# EAGLE schematic Driver Channel (EAGLE 9.7.0)
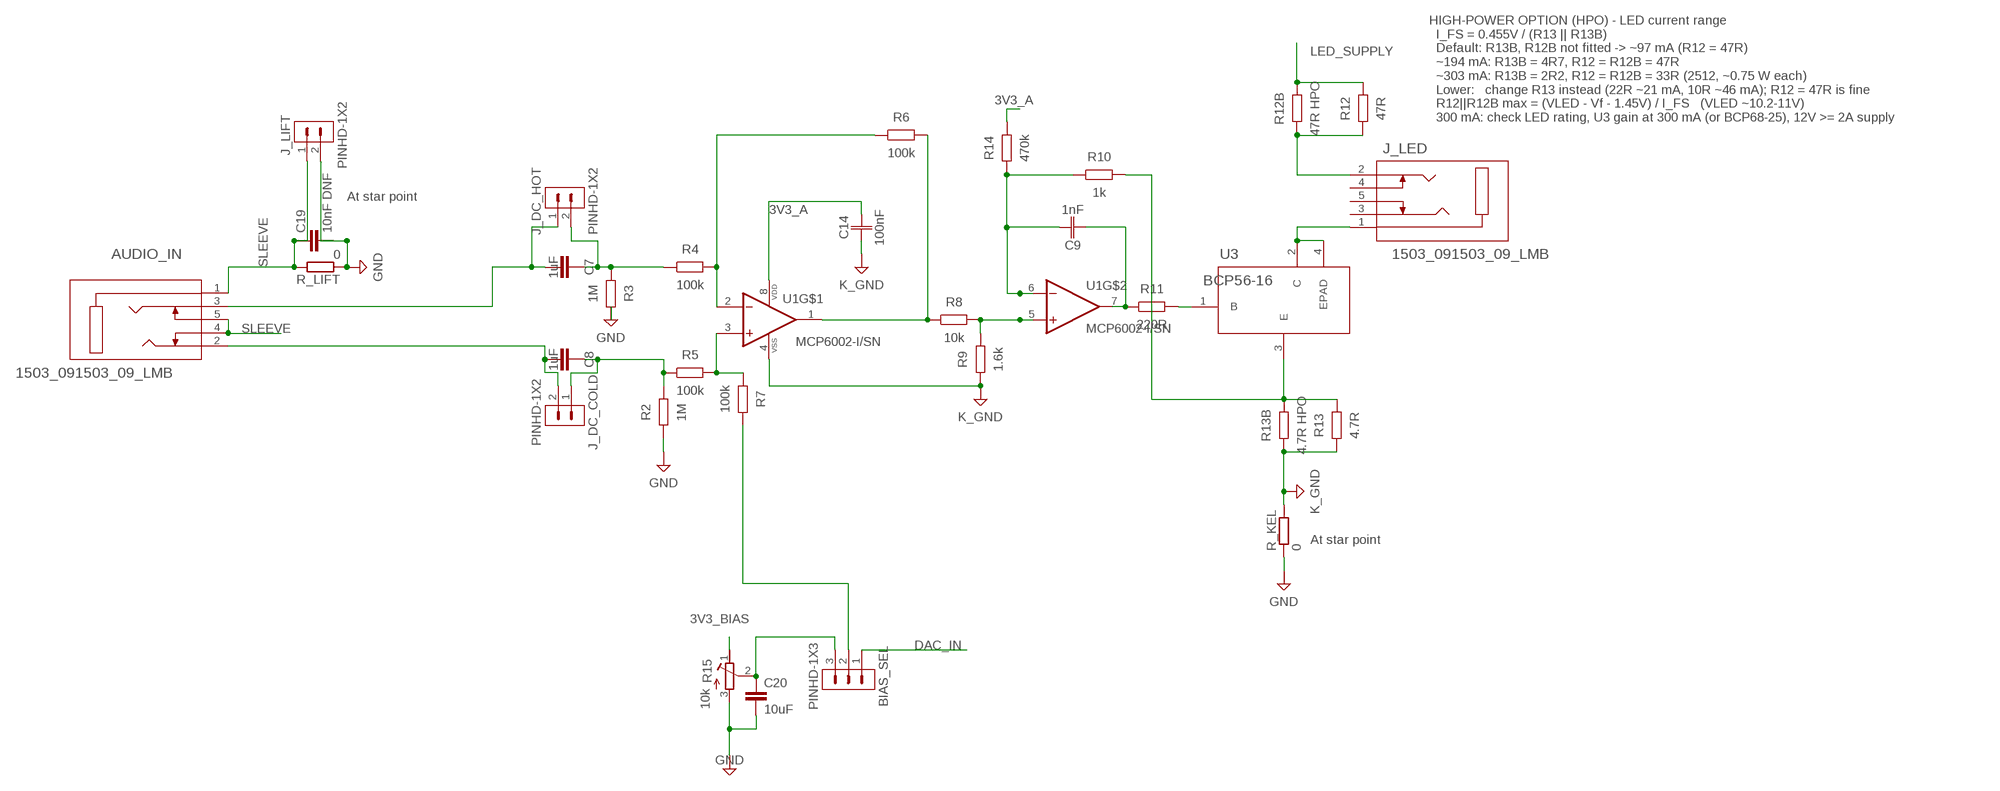
[diagram p0: schematic, sheet 1]

## Parts
AUDIO_IN  1503_091503_09_LMB  [1503_09_LMB]
BIAS_SEL  PINHD-1X3  [1X03]
C7  1uF  C-EUC0805  [C0805]
C8  1uF  C-EUC0805  [C0805]
C9  1nF  C_CHIP-0805(2012-METRIC)  [CAPC2012X110]
C14  100nF  C_CHIP-0805(2012-METRIC)  [CAPC2012X110]
C19  10nF DNF  C-EUC0805  [C0805]
C20  10uF  C-EUC0805  [C0805]
J_DC_COLD  PINHD-1X2  [1X02]
J_DC_HOT  PINHD-1X2  [1X02]
J_LED  1503_091503_09_LMB  [1503_09_LMB]
J_LIFT  PINHD-1X2  [1X02]
R2  1M  R_CHIP-1206(3216-METRIC)  [RESC3216X70]
R3  1M  R_CHIP-1206(3216-METRIC)  [RESC3216X70]
R4  100k  R_CHIP-1206(3216-METRIC)  [RESC3216X70]
R5  100k  R_CHIP-1206(3216-METRIC)  [RESC3216X70]
R6  100k  R_CHIP-1206(3216-METRIC)  [RESC3216X70]
R7  100k  R_CHIP-1206(3216-METRIC)  [RESC3216X70]
R8  10k  R_CHIP-1206(3216-METRIC)  [RESC3216X70]
R9  1.6k  R_CHIP-1206(3216-METRIC)  [RESC3216X70]
R10  1k  R_CHIP-1206(3216-METRIC)  [RESC3216X70]
R11  220R  R_CHIP-1206(3216-METRIC)  [RESC3216X70]
R12  47R  R_CHIP-2512(6332-METRIC)  [RESC6332X71]
R12B  47R HPO  R_CHIP-2512(6332-METRIC)  [RESC6332X71]
R13  4.7R  R_CHIP-1206(3216-METRIC)  [RESC3216X70]
R13B  4.7R HPO  R_CHIP-1206(3216-METRIC)  [RESC3216X70]
R14  470k  R_CHIP-1206(3216-METRIC)  [RESC3216X70]
R15  10k  R-TRIMM3314J  [RTRIM3314J]
R_KEL  0  R-EU_R0805  [R0805]
R_LIFT  0  R-EU_R0805  [R0805]
U1  MCP6002-I/SN  [SOIC127P600X175-8N]
U3  BCP56-16  BCP56-16T1GSOT-223_3P7X6P7_ONS  [SOT-223_3P7X6P7_ONS]

## Nets
3V3_A: C14.2 R14.2 U1.8(VDD)
3V3_BIAS: R15.1(E)
DAC_IN: BIAS_SEL.1
GND: C19.2 C20.2 J_LIFT.2 R2.1 R3.2 R15.3(A) R_KEL.1 R_LIFT.1
K_GND: C14.1 R9.1 R13.1 R13B.1 R_KEL.2 U1.4(VSS)
LED_SUPPLY: R12.2 R12B.2
N$1: C8.1 J_DC_COLD.1 R2.2 R5.1
N$2: C7.1 J_DC_HOT.2 R3.1 R4.1
N$3: R4.2 R6.1 U1.2(VINA-)
N$4: R5.2 R7.1 U1.3(VINA+)
N$5: R6.2 R8.1 U1.1(VOUTA)
N$6: R8.2 R9.2 U1.5(VINB+)
N$7: R11.2 U3.1(B)
N$8: J_LED.1 U3.2(C) U3.4(EPAD)
N$9: J_LED.2 R12.1 R12B.1
N$10: R10.2 R13.2 R13B.2 U3.3(E)
N$11: C9.1 R11.1 U1.7(VOUTB)
N$12: C9.2 R10.1 R14.1 U1.6(VINB-)
N$13: BIAS_SEL.3 C20.1 R15.2(S)
N$14: AUDIO_IN.2 C8.2 J_DC_COLD.2
N$15: AUDIO_IN.3 C7.2 J_DC_HOT.1
N$16: BIAS_SEL.2 R7.2
SLEEVE: AUDIO_IN.1 AUDIO_IN.4 AUDIO_IN.5 C19.1 J_LIFT.1 R_LIFT.2
Unconnected: J_LED.3 J_LED.4 J_LED.5

## Notes on the sheet
- HIGH-POWER OPTION (HPO) - LED current range
    I_FS = 0.455V / (R13 || R13B)
    Default: R13B, R12B not fitted -> ~97 mA (R12 = 47R)
    ~194 mA: R13B = 4R7, R12 = R12B = 47R
    ~303 mA: R13B = 2R2, R12 = R12B = 33R (2512, ~0.75 W each)
    Lower:   change R13 instead (22R ~21 mA, 10R ~46 mA); R12 = 47R is fine
    R12||R12B max = (VLED - Vf - 1.45V) / I_FS   (VLED ~10.2-11V)
    300 mA: check LED rating, U3 gain at 300 mA (or BCP68-25), 12V >= 2A supply
- At star point
- At star point

## Library data of the parts
AUDIO_IN J_LED = 3.5mm Jack:1503_09; COPYRIGHT: Copyright (C) 2026 Ultra Librarian. All rights reserved.; MANUFACTURER_NAME: Lumberg; MANUFACTURER_PART_NUMBER: 1503 09
BIAS_SEL = Connector:PINHD-1X3: Pin Header; CATEGORY_L1: Connectors; CATEGORY_L2: Headers; CATEGORY_L3: Male Pins; DESCRIPTION: Header-Straight-3 Position; PACKAGE: Through Hole; PITCH: 0.100" (2.54mm)
C7 C8 C19 C20 = rcl:C-EU: CAPACITOR, European symbol; SPICEPREFIX: C
C9 C14 = Capacitor:C: Capacitor - Generic; CATEGORY_L1: Capacitor; CATEGORY_L2: Ceramic Capacitors; CATEGORY_L3: MLCC; PACKAGE: Surface Mount; PACKAGE_SIZE: 0805
J_DC_COLD J_DC_HOT J_LIFT = Connector:PINHD-1X2: Pin Header; CATEGORY_L1: Connectors; CATEGORY_L2: Headers; CATEGORY_L3: Male Pins; DESCRIPTION: Header-Straight-2 Position; PACKAGE: Through Hole; PITCH: 0.100" (2.54mm)
R2-R11 R13 R13B R14 = Resistor:R: Resistor Fixed - Generic; CATEGORY_L1: Resistors; DESCRIPTION: Chip Resistor 3.20 X 1.60 X 0.70 mm body 1206(3216-METRIC) Package; PACKAGE: Surface Mount; PACKAGE_SIZE: 1206
R12 R12B = Resistor:R: Resistor Fixed - Generic; CATEGORY_L1: Resistors; DESCRIPTION: Chip Resistor 6.30 X 3.20 X 0.71 mm body 2512(6332-METRIC) Package; PACKAGE: Surface Mount; PACKAGE_SIZE: 2512
R15 = rcl:R-TRIMM: Trimm resistor; SPICEMODEL: X; SPICEPREFIXL: POT
R_KEL R_LIFT = rcl:R-EU_: RESISTOR, European symbol; SPICEPREFIX: R
U1 = MCP6002-I_SN:MCP6002-I/SN: Check availability <https://pricing.snapeda.com/parts/MCP6002-I/SN/Microchip%20Technology/view-part?ref=eda>; AVAILABILITY: In Stock; CHECK_PRICES: https://www.snapeda.com/parts/MCP6002-I/SN/Microchip+Technology/view-part/?ref=eda; DESCRIPTION: Microchip , Dual Op Amp, 1MHzCMOS, Rail to Rail, 3V, 5V, 8-Pin SOIC | Microchip Technology Inc. MCP6002-I/SN; MF: Microchip Technology; MP: MCP6002-I/SN; PACKAGE: SO-8 Microchip; PRICE: None; PURCHASE-URL: https://www.snapeda.com/api/url_track_click_mouser/?unipart_id=6177737&manufacturer=Microchip Technology&part_name=MCP6002-I/SN&search_term=mcp6002-i/sn; SNAPEDA_LINK: https://www.snapeda.com/parts/MCP6002-I/SN/Microchip+Technology/view-part/?ref=snap
U3 = BCP56:BCP56-16T1G; COPYRIGHT: Copyright (C) 2026 Ultra Librarian. All rights reserved.; MANUFACTURER_NAME: onsemi; MANUFACTURER_PART_NUMBER: BCP56-16T1G